# Altium project Servo-Board-v1.0.PrjPcb (part 8 of 23)

## Sheet DIO_3.SchDoc
size 420 x 297 mm; SheetNumber: 21; SheetTotal: 26
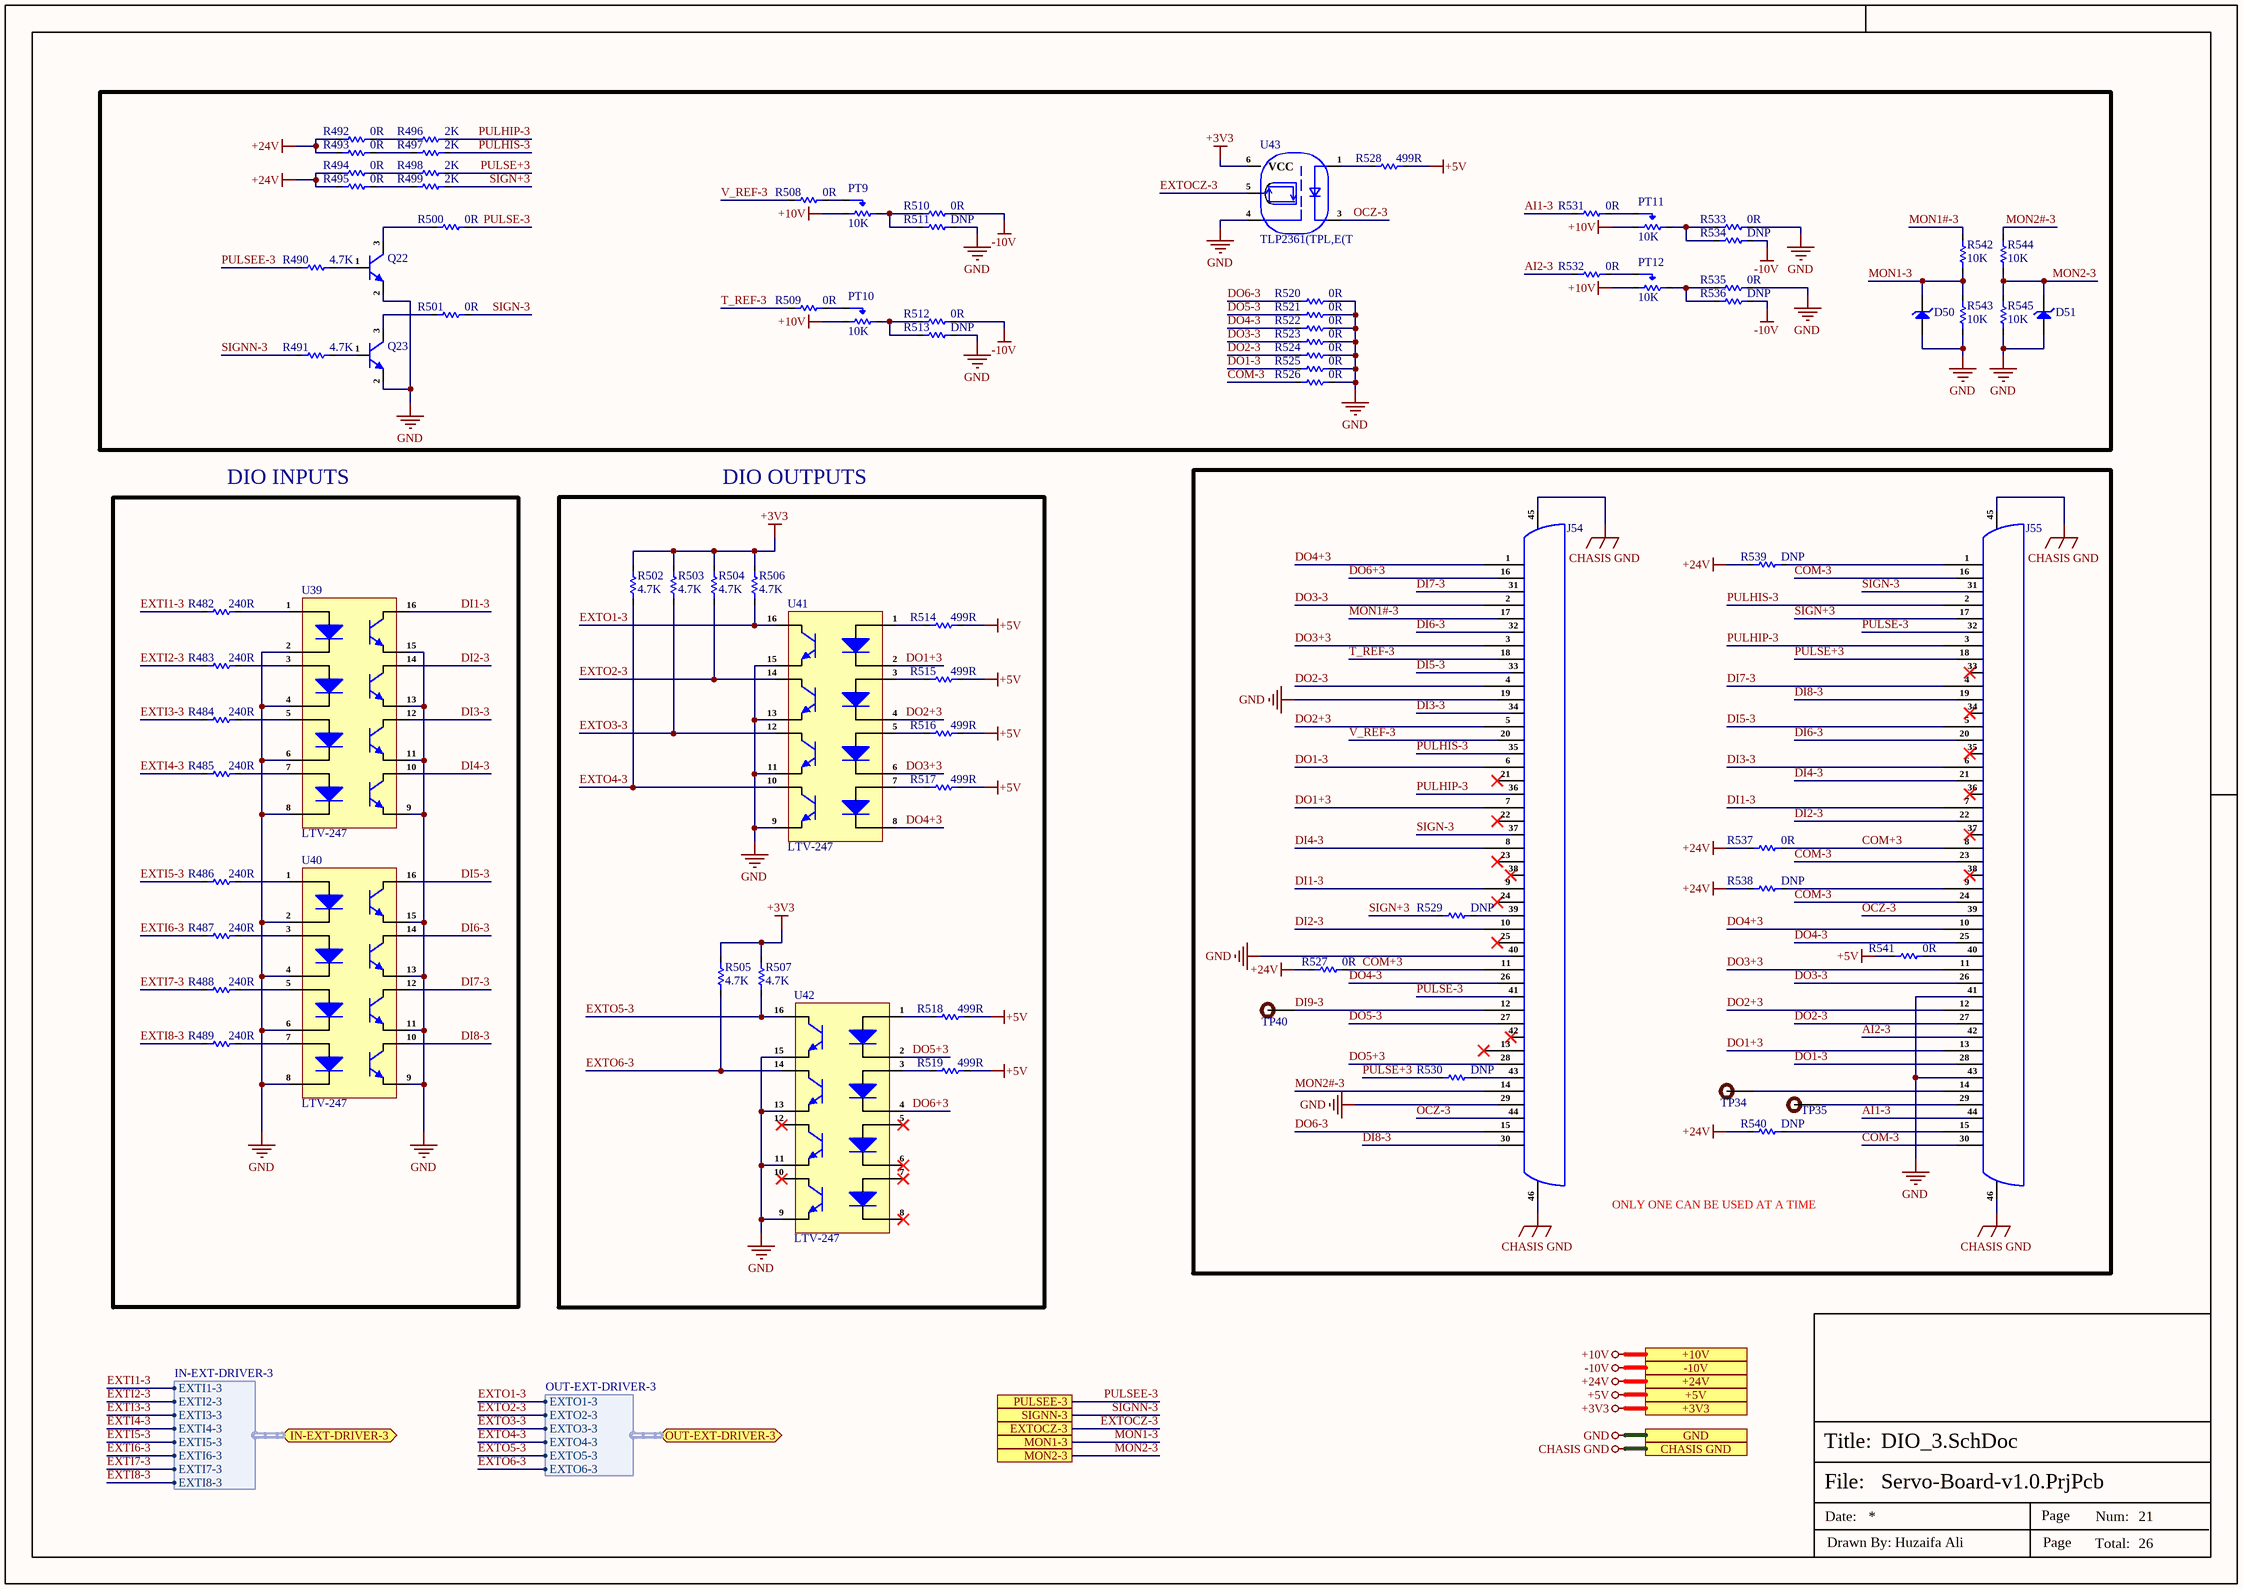
[diagram p9: DIO_3.SchDoc]

### Parts
D50  MM3Z3V3B  [SOD323F]  (value not drawn)
D51  MM3Z3V3B  [SOD323F]  (value not drawn)
J54  DS1038-44FBNSIA74-0CC  [DS1038-44FBNSIA74-0CC]  (value not drawn)
J55  DS1038-44FBNSIA74-0CC  [DS1038-44FBNSIA74-0CC]  (value not drawn)
PT9  10K  [3313J-1-103E]
PT10  10K  [3313J-1-103E]
PT11  10K  [3313J-1-103E]
PT12  10K  [3313J-1-103E]
Q22  NSS40201LT1G  [SOT-23]  (value not drawn)
Q23  NSS40201LT1G  [SOT-23]  (value not drawn)
R482  240R  [Res-0402]
R483  240R  [Res-0402]
R484  240R  [Res-0402]
R485  240R  [Res-0402]
R486  240R  [Res-0402]
R487  240R  [Res-0402]
R488  240R  [Res-0402]
R489  240R  [Res-0402]
R490  4.7K  [Res-0402]
R491  4.7K  [Res-0402]
R492  0R  [Res-0402]
R493  0R  [Res-0402]
R494  0R  [Res-0402]
R495  0R  [Res-0402]
R496  2K  [Res-0402]
R497  2K  [Res-0402]
R498  2K  [Res-0402]
R499  2K  [Res-0402]
R500  0R  [Res-0402]
R501  0R  [Res-0402]
R502  4.7K  [Res-0402]
R503  4.7K  [Res-0402]
R504  4.7K  [Res-0402]
R505  4.7K  [Res-0402]
R506  4.7K  [Res-0402]
R507  4.7K  [Res-0402]
R508  0R  [Res-0402]
R509  0R  [Res-0402]
R510  0R  [Res-0402]
R511  DNP  [Res-0402]
R512  0R  [Res-0402]
R513  DNP  [Res-0402]
R514  499R  [Res-0402]
R515  499R  [Res-0402]
R516  499R  [Res-0402]
R517  499R  [Res-0402]
R518  499R  [Res-0402]
R519  499R  [Res-0402]
R520  0R  [Res-0402]
R521  0R  [Res-0402]
R522  0R  [Res-0402]
R523  0R  [Res-0402]
R524  0R  [Res-0402]
R525  0R  [Res-0402]
R526  0R  [Res-0402]
R527  0R  [Res-0603]
R528  499R  [Res-0402]
R529  DNP  [Res-0402]
R530  DNP  [Res-0402]
R531  0R  [Res-0402]
R532  0R  [Res-0402]
R533  0R  [Res-0402]
R534  DNP  [Res-0402]
R535  0R  [Res-0402]
R536  DNP  [Res-0402]
R537  0R  [Res-0402]
R538  DNP  [Res-0402]
R539  DNP  [Res-0402]
R540  DNP  [Res-0402]
R541  0R  [Res-0402]
R542  10K  [Res-0402]
R543  10K  [Res-0402]
R544  10K  [Res-0402]
R545  10K  [Res-0402]
TP34  TEST POINT 0.5mm Dia  [Test-point - 0.5mm]  (value not drawn)  (no BOM)
TP35  TEST POINT 0.5mm Dia  [Test-point - 0.5mm]  (value not drawn)  (no BOM)
TP40  TEST POINT 0.5mm Dia  [Test-point - 0.5mm]  (value not drawn)  (no BOM)
U39  LTV-247  [16-SO]
U40  LTV-247  [16-SO]
U41  LTV-247  [16-SO]
U42  LTV-247  [16-SO]
U43  TLP2361(TPL,E(T  [SO-5]

### Blocks framed on the sheet
ONLY ONE CAN BE USED AT A TIME: J54 J55 R527 R529 R530 R537-R541 TP34 TP35 TP40

### Ports
+3V3 (see Servo3[4B], CAN_Sheet[4D], Controller_Sheet[5D], DIO_1[5D], DIO_2[5D], DIO_4[5D], Encoder_Sheet1[5D], Encoder_Sheet2[4D], Encoder_Sheet3[4D], Encoder_Sheet4[5D], EtherCAT_Sheet[5D], Motor_Driver_Sheet1[5D], Motor_Driver_Sheet2[5D], Motor_Driver_Sheet3[5D], Motor_Driver_Sheet4[5D], Power_Sheet[5D], RS485_RS232_Sheet[5D], Sec_Controller_Sheet1[5D], Sec_Controller_Sheet2[5D], Sec_Controller_Sheet3[5D], Sec_Controller_Sheet4[5D], Servo1[5D], Servo2[5D], Servo3[5D], Servo4[5D]), +5V (see Servo3[4A], CAN_Sheet[4D], Controller_Sheet[5D], DIO_1[5D], DIO_2[5D], DIO_4[5D], Encoder_Sheet1[5D], Encoder_Sheet2[4D], Encoder_Sheet3[4D], Encoder_Sheet4[5D], Power_Sheet[5D], Servo1[5D], Servo2[5D], Servo3[5D], Servo4[5D]), +10V (see Servo3[5A], DIO_1[5D], DIO_2[5D], DIO_4[5D], Power_Sheet[5D], Servo1[5D], Servo2[5D], Servo3[5D], Servo4[5D]), +24V (see Servo3[4A], DIO_1[5D], DIO_2[5D], DIO_4[5D], Power_Sheet[5D], Servo1[5D], Servo2[5D], Servo3[5D], Servo4[5D]), -10V (see Servo3[5A], DIO_1[5D], DIO_2[5D], DIO_4[5D], Power_Sheet[5D], Servo1[5D], Servo2[5D], Servo3[5D], Servo4[5D]), CHASIS GND (see Servo3[4B], DIO_1[5D], DIO_2[5D], DIO_4[5D], Encoder_Sheet1[5D], Encoder_Sheet2[4D], Encoder_Sheet3[4D], Encoder_Sheet4[5D], EtherCAT_Sheet[5D], Power_Sheet[5D], Servo1[5D], Servo2[5D], Servo3[5D], Servo4[5D]), EXTOCZ-3 (see Servo3[4B], Sec_Controller_Sheet3[5D]), GND (see Servo3[4B], CAN_Sheet[4D], Controller_Sheet[5D], DIO_1[5D], DIO_2[5D], DIO_4[5D], Encoder_Sheet1[5D], Encoder_Sheet2[4D], Encoder_Sheet3[4D], Encoder_Sheet4[5D], EtherCAT_Sheet[5D], Motor_Driver_Sheet1[5D], Motor_Driver_Sheet2[5D], Motor_Driver_Sheet3[5D], Motor_Driver_Sheet4[5D], Power_Sheet[5D], RS485_RS232_Sheet[5D], Sec_Controller_Sheet1[5D], Sec_Controller_Sheet2[5D], Sec_Controller_Sheet3[5D], Sec_Controller_Sheet4[5D], Servo1[5D], Servo2[5D], Servo3[5D], Servo4[5D]), IN-EXT-DRIVER-3 (bidir, harness IN-EXT-DRIVER-3, see Servo3[4B], Sec_Controller_Sheet3[3D]), MON1-3 (see Servo3[4B], Sec_Controller_Sheet3[5D]), MON2-3 (see Servo3[4B], Sec_Controller_Sheet3[5D]), OUT-EXT-DRIVER-3 (bidir, harness OUT-EXT-DRIVER-3, see Servo3[4B], Sec_Controller_Sheet3[3D]), PULSEE-3 (see Servo3[4B], Sec_Controller_Sheet3[5D]), SIGNN-3 (see Servo3[4B], Sec_Controller_Sheet3[5D])

### Harnesses
IN-EXT-DRIVER-3: EXTI1-3, EXTI2-3, EXTI3-3, EXTI4-3, EXTI5-3, EXTI6-3, EXTI7-3, EXTI8-3
OUT-EXT-DRIVER-3: EXTO1-3, EXTO2-3, EXTO3-3, EXTO4-3, EXTO5-3, EXTO6-3

### Nets
+3V3: R502.2 R503.2 R504.2 R505.2 R506.2 R507.2 U43.6(VCC) ; port +3V3
+5V: R514.2 R515.2 R516.2 R517.2 R518.2 R519.2 R528.2 R541.1 ; port +5V
+10V: PT9.1(CCW) PT10.1(CCW) PT11.1(CCW) PT12.1(CCW) ; port +10V
+24V: R492.1 R493.1 R494.1 R495.1 R527.1 R537.1 R538.1 R539.1 R540.1 ; port +24V
-10V: R510.2 R512.2 R534.2 R536.2 ; port -10V
CHASIS GND: J54.45 J54.46 J55.45 J55.46 ; port CHASIS GND
GND: D50.1(A) D51.1(A) J54.19 J54.29 J54.40 J55.41 J55.43 Q22.2(E) Q23.2(E) R511.2 R513.2 R520.2 R521.2 R522.2 R523.2 R524.2 R525.2 R526.2 R533.2 R535.2 R543.1 R545.1 U39.2(K) U39.4(K) U39.6(K) U39.8(K) U39.9(E) U39.11(E) U39.13(E) U39.15(E) U40.2(K) U40.4(K) U40.6(K) U40.8(K) U40.9(E) U40.11(E) U40.13(E) U40.15(E) U41.9(E) U41.11(E) U41.13(E) U41.15(E) U42.9(E) U42.11(E) U42.13(E) U42.15(E) U43.4(GND) ; port GND
AI1-3: J55.44 R531.1
AI2-3: J55.42 R532.1
COM+3: J54.11 J55.8 R527.2 R537.2
COM-3: J55.16 J55.23 J55.24 J55.30 R526.1
DI1-3: J54.9 J55.7 U39.16(C)
DI2-3: J54.10 J55.22 U39.14(C)
DI3-3: J54.34 J55.6 U39.12(C)
DI4-3: J54.8 J55.21 U39.10(C)
DI5-3: J54.33 J55.5 U40.16(C)
DI6-3: J54.32 J55.20 U40.14(C)
DI7-3: J54.31 J55.4 U40.12(C)
DI8-3: J54.30 J55.19 U40.10(C)
DI9-3: J54.12 TP40.1
DO1+3: J54.7 J55.13 U41.2(K)
DO1-3: J54.6 J55.28 R525.1
DO2+3: J54.5 J55.12 U41.4(K)
DO2-3: J54.4 J55.27 R524.1
DO3+3: J54.3 J55.11 U41.6(K)
DO3-3: J54.2 J55.26 R523.1
DO4+3: J54.1 J55.10 U41.8(K)
DO4-3: J54.26 J55.25 R522.1
DO5+3: J54.28 U42.2(K)
DO5-3: J54.27 R521.1
DO6+3: J54.16 U42.4(K)
DO6-3: J54.15 R520.1
EXTI1-3: R482.1 ; port IN-EXT-DRIVER-3.EXTI1-3
EXTI2-3: R483.1 ; port IN-EXT-DRIVER-3.EXTI2-3
EXTI3-3: R484.1 ; port IN-EXT-DRIVER-3.EXTI3-3
EXTI4-3: R485.1 ; port IN-EXT-DRIVER-3.EXTI4-3
EXTI5-3: R486.1 ; port IN-EXT-DRIVER-3.EXTI5-3
EXTI6-3: R487.1 ; port IN-EXT-DRIVER-3.EXTI6-3
EXTI7-3: R488.1 ; port IN-EXT-DRIVER-3.EXTI7-3
EXTI8-3: R489.1 ; port IN-EXT-DRIVER-3.EXTI8-3
EXTO1-3: R506.1 U41.16(C) ; port OUT-EXT-DRIVER-3.EXTO1-3
EXTO2-3: R504.1 U41.14(C) ; port OUT-EXT-DRIVER-3.EXTO2-3
EXTO3-3: R503.1 U41.12(C) ; port OUT-EXT-DRIVER-3.EXTO3-3
EXTO4-3: R502.1 U41.10(C) ; port OUT-EXT-DRIVER-3.EXTO4-3
EXTO5-3: R507.1 U42.16(C) ; port OUT-EXT-DRIVER-3.EXTO5-3
EXTO6-3: R505.1 U42.14(C) ; port OUT-EXT-DRIVER-3.EXTO6-3
EXTOCZ-3: U43.5(VO) ; port EXTOCZ-3
MON1#-3: J54.17 R542.2
MON1-3: D50.2(K) R542.1 R543.2 ; port MON1-3
MON2#-3: J54.14 R544.2
MON2-3: D51.2(K) R544.1 R545.2 ; port MON2-3
OCZ-3: J54.44 J55.39 U43.3(CAT)
PULHIP-3: J54.36 J55.3 R496.2
PULHIS-3: J54.35 J55.2 R497.2
PULSE+3: J55.18 R498.2 R530.1
PULSE-3: J54.41 J55.32 R500.2
PULSEE-3: R490.1 ; port PULSEE-3
SIGN+3: J55.17 R499.2 R529.1
SIGN-3: J54.37 J55.31 R501.2
SIGNN-3: R491.1 ; port SIGNN-3
T_REF-3: J54.18 R509.1
V_REF-3: J54.20 R508.1
NetJ54_39: J54.39 R529.2
NetJ54_43: J54.43 R530.2
NetJ55_1: J55.1 R539.2
NetJ55_9: J55.9 R538.2
NetJ55_14: J55.14 TP34.1
NetJ55_15: J55.15 R540.2
NetJ55_29: J55.29 TP35.1
NetJ55_40: J55.40 R541.2
NetPT9_2: PT9.2(Wiper) R508.2
NetPT9_3: PT9.3(CW) R510.1 R511.1
NetPT10_2: PT10.2(Wiper) R509.2
NetPT10_3: PT10.3(CW) R512.1 R513.1
NetPT11_2: PT11.2(Wiper) R531.2
NetPT11_3: PT11.3(CW) R533.1 R534.1
NetPT12_2: PT12.2(Wiper) R532.2
NetPT12_3: PT12.3(CW) R535.1 R536.1
NetQ22_1: Q22.1(B) R490.2
NetQ22_3: Q22.3(C) R500.1
NetQ23_1: Q23.1(B) R491.2
NetQ23_3: Q23.3(C) R501.1
NetR482_2: R482.2 U39.1(A)
NetR483_2: R483.2 U39.3(A)
NetR484_2: R484.2 U39.5(A)
NetR485_2: R485.2 U39.7(A)
NetR486_2: R486.2 U40.1(A)
NetR487_2: R487.2 U40.3(A)
NetR488_2: R488.2 U40.5(A)
NetR489_2: R489.2 U40.7(A)
NetR492_2: R492.2 R496.1
NetR493_2: R493.2 R497.1
NetR494_2: R494.2 R498.1
NetR495_2: R495.2 R499.1
NetR514_1: R514.1 U41.1(A)
NetR515_1: R515.1 U41.3(A)
NetR516_1: R516.1 U41.5(A)
NetR517_1: R517.1 U41.7(A)
NetR518_1: R518.1 U42.1(A)
NetR519_1: R519.1 U42.3(A)
NetR528_1: R528.1 U43.1(AN)

Not connected (* = marked no-connect by the designer): J54 13* 21* 22* 23* 24* 25* 38* 42*; J55 33* 34* 35* 36* 37* 38*; U42 5(A)* 6(K)* 7(A)* 8(K)* 10(C)* 12(C)*

### Notes on the sheet
- DIO INPUTS
- DIO OUTPUTS
- File:
- Title:
- Date:
- Page
- Num:
- Total:
- Drawn By: Huzaifa Ali

### Library data of the parts
D50 D51 = MM3Z3V3B: as D60 on sheet Motor_Driver_Sheet3; Supplier 1: Digi-Key; Manufacturer Part Number: MM3Z3V3B; Stock 1: 473644; Pricing 1: 1=0.22, 10=0.18, 100=0.0956, 500=0.06288, 1000=0.04276 (USD); Mount: Surface Mount; Number of Pins: 2; Weight: 0.0276g; Min Operating Temperature: -65°C; Max Operating Temperature: 150°C; Packaging: Tape and Reel; Package Quantity: 1; Max Power Dissipation: 200mW; Zener Voltage: 3.3V; Voltage Tolerance: 2%; Power Dissipation: 200mW; Working Voltage: 3.3V; Peak Reverse Current: 4.5uA; Length: 1.3mm; Height: 1mm; Width: 1.7mm; Radiation Hardening: No; REACH SVHC: No SVHC; Lead Free: Lead Free; ComponentLink1URL: http://www.onsemi.com/pub/Collateral/MM3Z9V1B-D.pdf?src-supplier=Digi-Key; ComponentLink1Description: http://www.onsemi.com/pub/Collateral/MM3Z9V1B-D.pdf?src-supplier=Digi-Key; ComponentLink2URL: http://www.mouser.com/ds/2/149/MM3Z3V3B-187166.pdf?src-supplier=Mouser; ComponentLink2Description: http://www.mouser.com/ds/2/149/MM3Z3V3B-187166.pdf?src-supplier=Mouser; ComponentLink3URL: https://www.fairchildsemi.com/datasheets/MM/MM3Z9V1B.pdf?src-supplier=Avnet; ComponentLink3Description: https://www.fairchildsemi.com/datasheets/MM/MM3Z9V1B.pdf?src-supplier=Avnet; ComponentLink4URL: http://www.farnell.com/datasheets/1706525.pdf?src-supplier=Element14; ComponentLink4Description: http://www.farnell.com/datasheets/1706525.pdf?src-supplier=Element14; Supplier Part Number 1: MM3Z3V3BCT-ND; LCSC Part Number: C2978865; Item Type: Diode
J54 J55 = DS1038-44FBNSIA74-0CC: 44P Female D-Sub Right-Angle 3 1.5A -40℃~+105℃ Push-Pull D-Sub / VGA connector ROHS; Manufacturer: CONNFLY Elec; Manufacturer Part Number: DS1038-44FBNSIA74-0CC; Package: Push-Pull; LCSC Part Number: C77844; Item Type: D-Sub / VGA connector; ComponentLink1Description: LCSC; ComponentLink1URL: https://www.lcsc.com/product-detail/D-Sub-VGA-connector_CONNFLY-Elec-DS1038-44FBNSIA74-0CC_C77844.html
PT9-PT12 = 3313J-1-103E: TRIMMER 10KOHM 0.125W J LEAD TOP; Manufacturer: Bourns; Value: 10kR; Tolerance: 20%; Power Rating: 125mW; Number of Turns: 1; Temperature Coefficient: 100ppm/°C; Insulation Resistance: 100MR; Voltage Rating (DC): 500V; Item Type: Potentiometer; Supplier 1: Digi-Key; Manufacturer Part Number: 3313J-1-103E; RoHS: Yes; Category: Variable Resistors and Potentiometers; Stock 1: 15653; Pricing 1: 1=1.83, 10=1.611, 25=1.4444, 50=1.3888, 100=1.3332, 250=1.27764, 500=1.05544 (USD); Mounting Technology: Surface Mount; Weight: 283mg; Color: Natural; Min Operating Temperature: -55°C; Max Operating Temperature: 125°C; Resistor Type: Cermet; Package Quantity: 1000; Packaging: Tape and Reel; Termination: J-Hook; Taper: Linear; Max Power Dissipation: 125mW; Type: Potentiometer; Series: Trimpot® 3313 - Sealed; Resistance Tolerance: 20%; Technology: CERMET; Length: 3.2mm; Width: 3.2mm; Height: 2.2mm; Depth: 3.5mm; Radiation Hardening: No; Reach SVHC Compliant: No; Military Standard: Not; Lead Free: Lead Free; RoHS Compliant: Yes; ComponentLink1URL: https://datasheet.ciiva.com/6197/1719390-6197392.pdf?src-supplier=Farnell; ComponentLink1Description: https://datasheet.ciiva.com/6197/1719390-6197392.pdf?src-supplier=Farnell; ComponentLink2URL: https://datasheet.ciiva.com/11831/0900766b80dbb89c-11831555.pdf?src-supplier=Rs; ComponentLink2Description: https://datasheet.ciiva.com/11831/0900766b80dbb89c-11831555.pdf?src-supplier=Rs; ComponentLink3URL: https://datasheet.ciiva.com/43573/1157501-43573718.pdf?src-supplier=Jameco; ComponentLink3Description: https://datasheet.ciiva.com/43573/1157501-43573718.pdf?src-supplier=Jameco; ComponentLink4URL: https://datasheet.ciiva.com/7953/1864507-7953225.pdf?src-supplier=Element14; ComponentLink4Description: https://datasheet.ciiva.com/7953/1864507-7953225.pdf?src-supplier=Element14; ComponentLink5URL: https://datasheet.ciiva.com/28659/1770668-28659191.pdf?src-supplier=Element14; ComponentLink5Description: https://datasheet.ciiva.com/28659/1770668-28659191.pdf?src-supplier=Element14; ComponentLink6URL: https://datasheet.ciiva.com/2156/3313-2156355.pdf?src-supplier=Digi-Key; ComponentLink6Description: https://datasheet.ciiva.com/2156/3313-2156355.pdf?src-supplier=Digi-Key; ComponentLink7URL: https://datasheet.ciiva.com/2156/3313-2156356.pdf?src-supplier=Digi-Key; ComponentLink7Description: https://datasheet.ciiva.com/2156/3313-2156356.pdf?src-supplier=Digi-Key; ComponentLink8URL: https://datasheet.ciiva.com/2156/3313-2156354.pdf?src-supplier=Digi-Key; ComponentLink8Description: https://datasheet.ciiva.com/2156/3313-2156354.pdf?src-supplier=Digi-Key; ComponentLink9URL: https://datasheet.ciiva.com/16715/70153423-16715693.pdf?src-supplier=Allied+Electronics; ComponentLink9Description: https://datasheet.ciiva.com/16715/70153423-16715693.pdf?src-supplier=Allied+Electronics; Supplier Part Number 1: 3313J-103ECT-ND; LCSC Part Number: C124616
Q22 Q23 = NSS40201LT1G: TRANS NPN 40V 2A SOT23-3; Manufacturer: ON Semiconductor; Max Power Dissipation: 540mW; Transition Frequency: 150MHz; hFE Min: 200; Number of Elements: 1; Emitter Base Voltage (VEBO): 6V; Collector Emitter Saturation Voltage: 115mV; Element Configuration: Single; Clock Frequency: 100MHz; Item Type: Transistor; Supplier 1: Future Electronics; Manufacturer Part Number: NSS40201LT1G; RoHS: Yes; Category: BJTs; Stock 1: 155; Pricing 1: 1=0.42000, 15=0.34000, 75=0.29500, 300=0.25500, 1500=0.21000 (USD); Case/Package: SOT-23-3; Pins: 3; Min Operating Temperature: -55°C; Max Operating Temperature: 150°C; Collector Emitter Voltage (VCEO): 40V; Packaging: Tape and Reel; Max Collector Current: 2A; Collector Emitter Breakdown Voltage: 40V; Polarity: NPN; Package Quantity: 3000; Frequency: 150MHz; Max Breakdown Voltage: 40V; Collector Base Voltage (VCBO): 40V; Power Dissipation: 540mW; Gain Bandwidth Product: 150MHz; Series: -; Collector-emitter Voltage-Max: 115mV; Length: 3.04mm; Width: 2.64mm; Height: 1.11mm; Radiation Hardening: No; Lead Free: Lead Free; Reach SVHC Compliant: Yes; Halogen Free: Halogen Free; RoHS Compliant: Yes; ComponentLink1URL: https://datasheet.ciiva.com/976/nss40201l-d-976800.pdf?src-supplier=Digi-Key; ComponentLink1Description: https://datasheet.ciiva.com/976/nss40201l-d-976800.pdf?src-supplier=Digi-Key; ComponentLink2URL: https://datasheet.ciiva.com/11204/nss40201l-d-11204882.pdf?src-supplier=Avnet; ComponentLink2Description: https://datasheet.ciiva.com/11204/nss40201l-d-11204882.pdf?src-supplier=Avnet; ComponentLink3URL: https://datasheet.ciiva.com/16291/nss40201l-d-115376-16291797.pdf?src-supplier=Mouser; ComponentLink3Description: https://datasheet.ciiva.com/16291/nss40201l-d-115376-16291797.pdf?src-supplier=Mouser; ComponentLink4URL: https://datasheet.ciiva.com/30480/0900766b8121b5a5-30480502.pdf?src-supplier=Rs; ComponentLink4Description: https://datasheet.ciiva.com/30480/0900766b8121b5a5-30480502.pdf?src-supplier=Rs; ComponentLink5URL: https://datasheet.ciiva.com/976/nss40201l-d-976801.pdf?src-supplier=Digi-Key; ComponentLink5Description: https://datasheet.ciiva.com/976/nss40201l-d-976801.pdf?src-supplier=Digi-Key; ComponentLink6URL: https://datasheet.ciiva.com/976/nss40201l-d-976802.pdf?src-supplier=Digi-Key; ComponentLink6Description: https://datasheet.ciiva.com/976/nss40201l-d-976802.pdf?src-supplier=Digi-Key; ComponentLink7URL: https://datasheet.ciiva.com/22641/nss40201l-d-22641179.pdf?src-supplier=Farnell; ComponentLink7Description: https://datasheet.ciiva.com/22641/nss40201l-d-22641179.pdf?src-supplier=Farnell; ComponentLink8URL: https://datasheet.ciiva.com/16222/nss40201l-d-16222093.pdf?src-supplier=Future+Electronics; ComponentLink8Description: https://datasheet.ciiva.com/16222/nss40201l-d-16222093.pdf?src-supplier=Future+Electronics; Supplier Part Number 1: 6030674; LCSC Part Number: C145175
R482-R489 = RC0402FR-07240RL: as R214 on sheet Motor_Driver_Sheet3; Supplier 1: Mouser; Manufacturer Part Number: RC0402FR-07240RL; RoHS: Yes; Stock 1: 1903202; Pricing 1: 1=0.10000, 10=0.01200, 50=0.01200, 100=0.00500, 1000=0.00300, 10000=0.00100 (USD); Case/Package: 0402; Case Code (Metric): 1005; Case Code (Imperial): 0402; Size Code: 0402; Min Operating Temperature: -55°C; Max Operating Temperature: 155°C; Resistance: 240R; Tolerance: 1%; Packaging: Tape and Reel; Resistor Type: Thick Film; Voltage Rating: 50V; Package Quantity: 1; Number of Terminations: 2; Termination: SMD/SMT; Max Power Dissipation: 63mW; Features: Moisture Resistant; Series: RC; Construction: Rectangular; Resistance Tolerance: 1%; Length: 1mm; Width: 0.02inch; Height: 0.016inch; Depth: 0.5mm; REACH SVHC: Unknown; Lead Free: Lead Free; RoHS Compliant: Yes; Military Standard: Not; ComponentLink1URL: https://datasheet.ciiva.com/7849/1018594-7849915.pdf?src-supplier=Element14; ComponentLink1Description: https://datasheet.ciiva.com/7849/1018594-7849915.pdf?src-supplier=Element14; ComponentLink2URL: https://datasheet.ciiva.com/7849/1018594-7849916.pdf?src-supplier=Element14; ComponentLink2Description: https://datasheet.ciiva.com/7849/1018594-7849916.pdf?src-supplier=Element14; ComponentLink3URL: https://datasheet.ciiva.com/2519/pyu-r-int-thick-7-2519157.pdf?src-supplier=Digi-Key; ComponentLink3Description: https://datasheet.ciiva.com/2519/pyu-r-int-thick-7-2519157.pdf?src-supplier=Digi-Key; ComponentLink4URL: https://datasheet.ciiva.com/2519/pyu-r-int-thick-7-2519158.pdf?src-supplier=Digi-Key; ComponentLink4Description: https://datasheet.ciiva.com/2519/pyu-r-int-thick-7-2519158.pdf?src-supplier=Digi-Key; ComponentLink5URL: https://datasheet.ciiva.com/2519/pyu-r-int-thick-7-2519156.pdf?src-supplier=Digi-Key; ComponentLink5Description: https://datasheet.ciiva.com/2519/pyu-r-int-thick-7-2519156.pdf?src-supplier=Digi-Key; ComponentLink6URL: https://datasheet.ciiva.com/12669/pyu-rc0402-51-rohs-l-6-r-12669689.pdf?src-supplier=Mouser; ComponentLink6Description: https://datasheet.ciiva.com/12669/pyu-rc0402-51-rohs-l-6-r-12669689.pdf?src-supplier=Mouser; ComponentLink7URL: https://datasheet.ciiva.com/17419/pyu-rc0402-51-rohs-l-6-r-17419482.pdf?src-supplier=Future+Electronics; ComponentLink7Description: https://datasheet.ciiva.com/17419/pyu-rc0402-51-rohs-l-6-r-17419482.pdf?src-supplier=Future+Electronics; Supplier Part Number 1: 603-RC0402FR-07240RL; LCSC Part Number: C114755
R490 R491 R502-R507 = RC0402FR-074K7L: as R210 on sheet Motor_Driver_Sheet3; Supplier 1: Avnet; Manufacturer Part Number: RC0402FR-074K7L; RoHS: Yes; Category: Chip SMD Resistors; Stock 1: 2420000; Pricing 1: 10000=0.00085 (USD); Case/Package: 0402; Number of Pins: 2; Case Code (Imperial): 0402; Case Code (Metric): 1005; Size Code: 0402; Min Operating Temperature: -55°C; Max Operating Temperature: 155°C; Tolerance: 1%; Voltage Rating: 50V; Packaging: Tape and Reel; Resistor Type: Thick Film; Termination: SMD/SMT; Features: Moisture Resistant; Series: RC; Number of Terminations: 2; Resistance Tolerance: 1%; Construction: Rectangular; Length: 1mm; Width: 0.5mm; Height: 0.32mm; Depth: 0.5mm; Height - Seated (Max): 0.016inch; RoHS Compliant: Yes; Reach SVHC Compliant: Yes; Military Standard: Not; Lead Free: Lead Free; ComponentLink1URL: https://datasheet.ciiva.com/22661/1686128-22661342.pdf?src-supplier=Element14; ComponentLink1Description: https://datasheet.ciiva.com/22661/1686128-22661342.pdf?src-supplier=Element14; ComponentLink2URL: https://datasheet.ciiva.com/7850/1018594-7850022.pdf?src-supplier=Element14; ComponentLink2Description: https://datasheet.ciiva.com/7850/1018594-7850022.pdf?src-supplier=Element14; ComponentLink3URL: https://datasheet.ciiva.com/7850/1018594-7850023.pdf?src-supplier=Element14; ComponentLink3Description: https://datasheet.ciiva.com/7850/1018594-7850023.pdf?src-supplier=Element14; ComponentLink4URL: https://datasheet.ciiva.com/15215/getdatasheetpartid-328119-15215035.pdf?src-supplier=Verical; ComponentLink4Description: https://datasheet.ciiva.com/15215/getdatasheetpartid-328119-15215035.pdf?src-supplier=Verical; Supplier Part Number 1: RC0402FR-074K7L; LCSC Part Number: C105871
R492-R495 R500 R501 R508-R510 R512 R520-R526 R531-R533 R535 R537 R541 = RC0402FR-070RL: as R122 on sheet Sec_Controller_Sheet3; Supplier 1: Mouser; Manufacturer Part Number: RC0402FR-070RL; RoHS: Yes; Stock 1: 8556842; Pricing 1: 1=0.10000, 10=0.01400, 50=0.01400, 100=0.00600, 1000=0.00300, 5000=0.00200, 10000=0.00100 (USD); Mount: Surface Mount; Case/Package: 0402; Contact Plating: Tin,Matte; Case Code (Imperial): 0402; Case Code (Metric): 1005; Size Code: 0402; Min Operating Temperature: -55°C; Max Operating Temperature: 155°C; Resistance: 0R; Resistor Type: Thick Film; Packaging: Tape and Reel; Termination: SMD/SMT; Features: Moisture Resistant; Series: RC; Number of Terminations: 2; Length: 1mm; Width: 0.5mm; Height: 0.35mm; Radiation Hardening: No; Lead Free: Lead Free; RoHS Compliant: Yes; ComponentLink1URL: https://datasheet.ciiva.com/8896/pyu-rc0402-51-rohs-l-6-8896149.pdf?src-supplier=Avnet; ComponentLink1Description: https://datasheet.ciiva.com/8896/pyu-rc0402-51-rohs-l-6-8896149.pdf?src-supplier=Avnet; ComponentLink2URL: https://datasheet.ciiva.com/16790/pyu-rc0402-51-rohs-l-6-r-16790444.pdf?src-supplier=Future+Electronics; ComponentLink2Description: https://datasheet.ciiva.com/16790/pyu-rc0402-51-rohs-l-6-r-16790444.pdf?src-supplier=Future+Electronics; Supplier Part Number 1: 603-RC0402FR-070RL; LCSC Part Number: C106231
R496-R499 = RC0402FR-072KL: RES 2K OHM 1% 1/16W 0402; Manufacturer: Yageo; Item Type: Resistor; Value: 2kR; Power Rating: 63mW; Voltage Rating: 50V; Temperature Coefficient: 100ppm/°C; LCSC Part Number: C60488; ComponentLink2URL: https://datasheet.ciiva.com/11808/0900766b80c66297-11808787.pdf?src-supplier=Rs; ComponentLink2Description: https://datasheet.ciiva.com/11808/0900766b80c66297-11808787.pdf?src-supplier=Rs; ComponentLink3URL: https://datasheet.ciiva.com/7849/1018594-7849934.pdf?src-supplier=Element14; ComponentLink3Description: https://datasheet.ciiva.com/7849/1018594-7849934.pdf?src-supplier=Element14; ComponentLink4URL: https://datasheet.ciiva.com/7849/1018594-7849935.pdf?src-supplier=Element14; ComponentLink4Description: https://datasheet.ciiva.com/7849/1018594-7849935.pdf?src-supplier=Element14; ComponentLink5URL: https://datasheet.ciiva.com/7983/1018594-7983517.pdf?src-supplier=Element14; ComponentLink5Description: https://datasheet.ciiva.com/7983/1018594-7983517.pdf?src-supplier=Element14; ComponentLink6URL: https://datasheet.ciiva.com/2453/pyu-r-int-thick-7-2453635.pdf?src-supplier=Digi-Key; ComponentLink6Description: https://datasheet.ciiva.com/2453/pyu-r-int-thick-7-2453635.pdf?src-supplier=Digi-Key; ComponentLink7URL: https://datasheet.ciiva.com/2453/pyu-r-int-thick-7-2453636.pdf?src-supplier=Digi-Key; ComponentLink7Description: https://datasheet.ciiva.com/2453/pyu-r-int-thick-7-2453636.pdf?src-supplier=Digi-Key; ComponentLink8URL: https://datasheet.ciiva.com/2453/pyu-r-int-thick-7-2453634.pdf?src-supplier=Digi-Key; ComponentLink8Description: https://datasheet.ciiva.com/2453/pyu-r-int-thick-7-2453634.pdf?src-supplier=Digi-Key; ComponentLink9URL: https://datasheet.ciiva.com/12667/pyu-rc0402-51-rohs-l-6-r-12667451.pdf?src-supplier=Mouser; ComponentLink9Description: https://datasheet.ciiva.com/12667/pyu-rc0402-51-rohs-l-6-r-12667451.pdf?src-supplier=Mouser; ComponentLink10URL: https://datasheet.ciiva.com/15189/getdatasheetpartid-358921-15189414.pdf?src-supplier=Verical; ComponentLink10Description: https://datasheet.ciiva.com/15189/getdatasheetpartid-358921-15189414.pdf?src-supplier=Verical; Supplier: Future Electronics; Supplier Part Number: 7970452; Manufacturer Part Number: RC0402FR-072KL; RoHS: Yes; Category: Chip SMD Resistors; Stock: 8530000; Pricing: 10000=0.0018, 100000=0.0011, 200000=0.0017, 300000=0.001, 750000=0.0016, 2000000=0.0009, 2500000=0.0016, 10000000=0.0014 (USD); Case/Package: 0402; Case Code (Metric): 1005; Case Code (Imperial): 0402; Min Operating Temperature: -55°C; Max Operating Temperature: 155°C; Resistor Type: Thick Film; Tolerance: 1%; Package Quantity: 1; Packaging: Tape and Reel; Number of Terminations: 2; Termination: SMD/SMT; Max Power Dissipation: 63mW; Working Voltage: 50V; Features: Moisture Resistant; Series: RC; Technology: THICK FILM; Construction: Rectangular; Resistance Tolerance: 1%; Voltage Rating (DC): 50V; Length: 0.039inch; Width: 0.02inch; Height: 0.016inch; Depth: 0.5mm; RoHS Compliant: Yes; Military Standard: Not; Reach SVHC Compliant: Unknown; Lead Free: 5697LeadFree; ComponentLink1URL: https://datasheet.ciiva.com/11808/0900766b80c66297-11808787.pdf?src-supplier=Rs; ComponentLink1Description: https://datasheet.ciiva.com/11808/0900766b80c66297-11808787.pdf?src-supplier=Rs; ComponentLink11URL: https://datasheet.ciiva.com/2453/pyu-r-int-thick-7-2453635.pdf?src-supplier=Digikey; ComponentLink11Description: https://datasheet.ciiva.com/2453/pyu-r-int-thick-7-2453635.pdf?src-supplier=Digikey; ComponentLink12URL: https://datasheet.ciiva.com/2453/pyu-r-int-thick-7-2453636.pdf?src-supplier=Digikey; ComponentLink12Description: https://datasheet.ciiva.com/2453/pyu-r-int-thick-7-2453636.pdf?src-supplier=Digikey; ComponentLink13URL: https://datasheet.ciiva.com/2453/pyu-r-int-thick-7-2453634.pdf?src-supplier=Digikey; ComponentLink13Description: https://datasheet.ciiva.com/2453/pyu-r-int-thick-7-2453634.pdf?src-supplier=Digikey
R511 R513 R529 R530 R534 R536 R538-R540 = RC0402FR-070RL: as R127 on sheet Sec_Controller_Sheet3; Supplier 1: Mouser; Manufacturer Part Number: RC0402FR-070RL; RoHS: Yes; Stock 1: 8556842; Pricing 1: 1=0.10000, 10=0.01400, 50=0.01400, 100=0.00600, 1000=0.00300, 5000=0.00200, 10000=0.00100 (USD); Mount: Surface Mount; Case/Package: 0402; Contact Plating: Tin,Matte; Case Code (Imperial): 0402; Case Code (Metric): 1005; Size Code: 0402; Min Operating Temperature: -55°C; Max Operating Temperature: 155°C; Resistor Type: Thick Film; Packaging: Tape and Reel; Termination: SMD/SMT; Features: Moisture Resistant; Series: RC; Number of Terminations: 2; Length: 1mm; Width: 0.5mm; Height: 0.35mm; Radiation Hardening: No; Lead Free: Lead Free; RoHS Compliant: Yes; ComponentLink1URL: https://datasheet.ciiva.com/8896/pyu-rc0402-51-rohs-l-6-8896149.pdf?src-supplier=Avnet; ComponentLink1Description: https://datasheet.ciiva.com/8896/pyu-rc0402-51-rohs-l-6-8896149.pdf?src-supplier=Avnet; ComponentLink2URL: https://datasheet.ciiva.com/16790/pyu-rc0402-51-rohs-l-6-r-16790444.pdf?src-supplier=Future+Electronics; ComponentLink2Description: https://datasheet.ciiva.com/16790/pyu-rc0402-51-rohs-l-6-r-16790444.pdf?src-supplier=Future+Electronics; Supplier Part Number 1: 603-RC0402FR-070RL; LCSC Part Number: C106231
R514-R519 R528 = RC0402FR-07499RL: RES 499 OHM 1% 1/16W 0402; Manufacturer: Yageo; Power Rating: 62.5mW; Voltage Rating: 50V; Max Power Dissipation: 63mW; Temperature Coefficient: 100ppm/°C; Supplier 1: Mouser; Manufacturer Part Number: RC0402FR-07499RL; RoHS: Yes; Category: Chip SMD Resistors; Stock 1: 936879; Pricing 1: 1=0.10000, 10=0.01200, 50=0.01200, 100=0.00500, 1000=0.00300, 10000=0.00100 (USD); Case/Package: 0402; Case Code (Metric): 1005; Case Code (Imperial): 0402; Size Code: 0402; Min Operating Temperature: -55°C; Max Operating Temperature: 155°C; Resistance: 499R; Tolerance: 1%; Package Quantity: 1; Packaging: Tape and Reel; Resistor Type: Thick Film; Number of Terminations: 2; Termination: SMD/SMT; Voltage Rating (DC): 50V; Features: Moisture Resistant; Series: RC; Resistance Tolerance: 1%; Construction: Rectangular; Length: 1mm; Width: 0.02inch; Height: 0.016inch; Depth: 0.5mm; RoHS Compliant: Yes; REACH SVHC: No SVHC; Military Standard: Not; Lead Free: Lead Free; ComponentLink1URL: https://datasheet.ciiva.com/2453/pyu-r-int-thick-7-2453539.pdf?src-supplier=Digi-Key; ComponentLink1Description: https://datasheet.ciiva.com/2453/pyu-r-int-thick-7-2453539.pdf?src-supplier=Digi-Key; ComponentLink2URL: https://datasheet.ciiva.com/2453/pyu-r-int-thick-7-2453540.pdf?src-supplier=Digi-Key; ComponentLink2Description: https://datasheet.ciiva.com/2453/pyu-r-int-thick-7-2453540.pdf?src-supplier=Digi-Key; ComponentLink3URL: https://datasheet.ciiva.com/2453/pyu-r-int-thick-7-2453538.pdf?src-supplier=Digi-Key; ComponentLink3Description: https://datasheet.ciiva.com/2453/pyu-r-int-thick-7-2453538.pdf?src-supplier=Digi-Key; Supplier Part Number 1: 603-RC0402FR-07499RL; LCSC Part Number: C137970
R527 = RC0603JR-070RL: as R114 on sheet Sec_Controller_Sheet3; Supplier 1: Digi-Key; Manufacturer Part Number: RC0603JR-070RL; RoHS: Yes; Category: Chip SMD Resistors; Stock 1: 18081776; Pricing 1: 1=0.10000, 10=0.01700, 25=0.01240, 50=0.00960, 100=0.00700, 250=0.00536, 500=0.00430, 1000=0.00316 (USD); Case/Package: 0603; Number of Pins: 2; Contact Plating: Tin,Matte; Case Code (Imperial): 0603; Case Code (Metric): 1608; Size Code: 0603; Min Operating Temperature: -55°C; Max Operating Temperature: 155°C; Resistor Type: Thick Film; Packaging: Tape and Reel; Termination: SMD/SMT; Series: RC; Technology: THICK FILM; Package Quantity: 5000; Voltage Rating: 50V; Features: Moisture Resistant; Max Power Dissipation: 100mW; Number of Terminations: 2; Construction: Rectangular; Length: 1.6mm; Width: 0.8mm; Height: 0.45mm; Depth: 0.8mm; Radiation Hardening: No; Reach SVHC Compliant: No SVHC; Lead Free: Lead Free; RoHS Compliant: Yes; Military Standard: Not; Supplier Part Number 1: 311-0.0GRCT-ND; LCSC Part Number: C95177
R542-R545 = RC0402FR-0710KL: as R116 on sheet Sec_Controller_Sheet3; Supplier 1: Mouser; Manufacturer Part Number: RC0402FR-0710KL; RoHS: Yes; Category: Chip SMD Resistors; Stock 1: 18648329; Pricing 1: 1=0.10000, 10=0.01400, 50=0.01400, 100=0.00500, 1000=0.00300, 10000=0.00200 (USD); Case/Package: 0402; Number of Pins: 2; Case Code (Imperial): 0402; Case Code (Metric): 1005; Min Operating Temperature: -55°C; Max Operating Temperature: 155°C; Resistor Type: Thick Film; Tolerance: 1%; Packaging: Tape and Reel; Voltage Rating: 50V; Termination: SMD/SMT; Working Voltage: 50V; Number of Terminations: 2; Features: Moisture Resistant; Series: RC; Resistance Tolerance: 1%; Construction: Rectangular; Length: 1mm; Width: 0.5mm; Height: 0.32mm; Depth: 0.5mm; Lead Pitch: 0.2mm; REACH SVHC: No SVHC; Lead Free: Lead Free; RoHS Compliant: Yes; Military Standard: Not; ComponentLink1URL: https://datasheet.ciiva.com/7660/38568-7660787.pdf?src-supplier=Element14; ComponentLink1Description: https://datasheet.ciiva.com/7660/38568-7660787.pdf?src-supplier=Element14; ComponentLink2URL: https://datasheet.ciiva.com/7849/1686128-7849814.pdf?src-supplier=Element14; ComponentLink2Description: https://datasheet.ciiva.com/7849/1686128-7849814.pdf?src-supplier=Element14; ComponentLink3URL: https://datasheet.ciiva.com/7983/1018594-7983486.pdf?src-supplier=Element14; ComponentLink3Description: https://datasheet.ciiva.com/7983/1018594-7983486.pdf?src-supplier=Element14; ComponentLink4URL: https://datasheet.ciiva.com/22747/1018594-22747512.pdf?src-supplier=Element14; ComponentLink4Description: https://datasheet.ciiva.com/22747/1018594-22747512.pdf?src-supplier=Element14; ComponentLink5URL: https://datasheet.ciiva.com/12667/pyu-rc0402-51-rohs-l-6-r-12667067.pdf?src-supplier=Mouser; ComponentLink5Description: https://datasheet.ciiva.com/12667/pyu-rc0402-51-rohs-l-6-r-12667067.pdf?src-supplier=Mouser; ComponentLink6URL: https://datasheet.ciiva.com/7849/1784430-7849813.pdf?src-supplier=Element14; ComponentLink6Description: https://datasheet.ciiva.com/7849/1784430-7849813.pdf?src-supplier=Element14; ComponentLink7URL: https://datasheet.ciiva.com/7849/1784430-7849815.pdf?src-supplier=Element14; ComponentLink7Description: https://datasheet.ciiva.com/7849/1784430-7849815.pdf?src-supplier=Element14; Supplier Part Number 1: 603-RC0402FR-0710KL; LCSC Part Number: C60490
TP34 TP35 TP40 = TEST POINT 0.5mm Dia: Test Point ON; Item Type: Test Point; Manufacturer Part Number: TEST POINT 0.5mm Dia
U39-U42 = LTV-247: OPTOISO 3.75KV 4CH TRANS 16SO; Manufacturer: Vishay Lite-On; Number of Channels: 4; Collector Emitter Voltage (VCEO): 80V; Reverse Breakdown Voltage: 6V; Forward Voltage: 1.2V; Forward Current: 20mA; Max Power Dissipation: 200mW; Output Current per Channel: 50mA; Collector Emitter Saturation Voltage: 400mV; Power Dissipation: 170mW; Current Transfer Ratio: 600%; Item Type: PhotoTransistor; Supplier 1: Future Electronics; Manufacturer Part Number: LTV-247; RoHS: Yes; Category: Optocouplers; Stock 1: 178000; Pricing 1: 2000=0.77000 (USD); Mount: Surface Mount; Case/Package: SMD/SMT; Number of Pins: 16; Min Operating Temperature: -55°C; Max Operating Temperature: 110°C; Package Quantity: 2000; Packaging: Tape and Reel; Max Output Voltage: 80V; Max Collector Current: 50mA; Number of Elements: 4; Max Input Current: 50mA; Radiation Hardening: No; RoHS Compliant: Yes; ComponentLink1URL: https://datasheet.ciiva.com/24015/ltv-247-256860-24015561.pdf?src-supplier=Mouser; ComponentLink1Description: https://datasheet.ciiva.com/24015/ltv-247-256860-24015561.pdf?src-supplier=Mouser; ComponentLink2URL: https://datasheet.ciiva.com/29730/ltv-214-244-29730320.pdf?src-supplier=Digi-Key; ComponentLink2Description: https://datasheet.ciiva.com/29730/ltv-214-244-29730320.pdf?src-supplier=Digi-Key; Supplier Part Number 1: 3051235; LCSC Part Number: C115451; ComponentLink3Description: LCSC; ComponentLink3URL: https://www.lcsc.com/product-detail/Optocouplers-Phototransistor-Output_Lite-On-LTV-247_C115451.html
U43 = TLP2361(TPL,E(T: 15Mbit/s 80ns 2.7V~5.5V 20kV/us DC SO-5 Logic Output Optoisolators ROHS; Manufacturer: Toshiba; Supplier: Arrow Electronics; LCSC Part Number: C107626; Manufacturer Part Number: TLP2361(TPL,E(T; RoHS: No; Stock: 15000; Pricing: 3000=0.3233, 6000=0.3199, 9000=0.3167, 12000=0.3136, 15000=0.3102, 30000=0.3071 (USD); ComponentLink1URL: https://datasheet.octopart.com/TLP2361%28TPL%2CE%28T-Toshiba-datasheet-62094047.pdf?src-supplier=TME; ComponentLink1Description: https://datasheet.octopart.com/TLP2361%28TPL%2CE%28T-Toshiba-datasheet-62094047.pdf?src-supplier=TME; Item Type: Optoisolator

## Sheet Servo4.SchDoc
size 420 x 297 mm; SheetNumber: 22; SheetTotal: 26
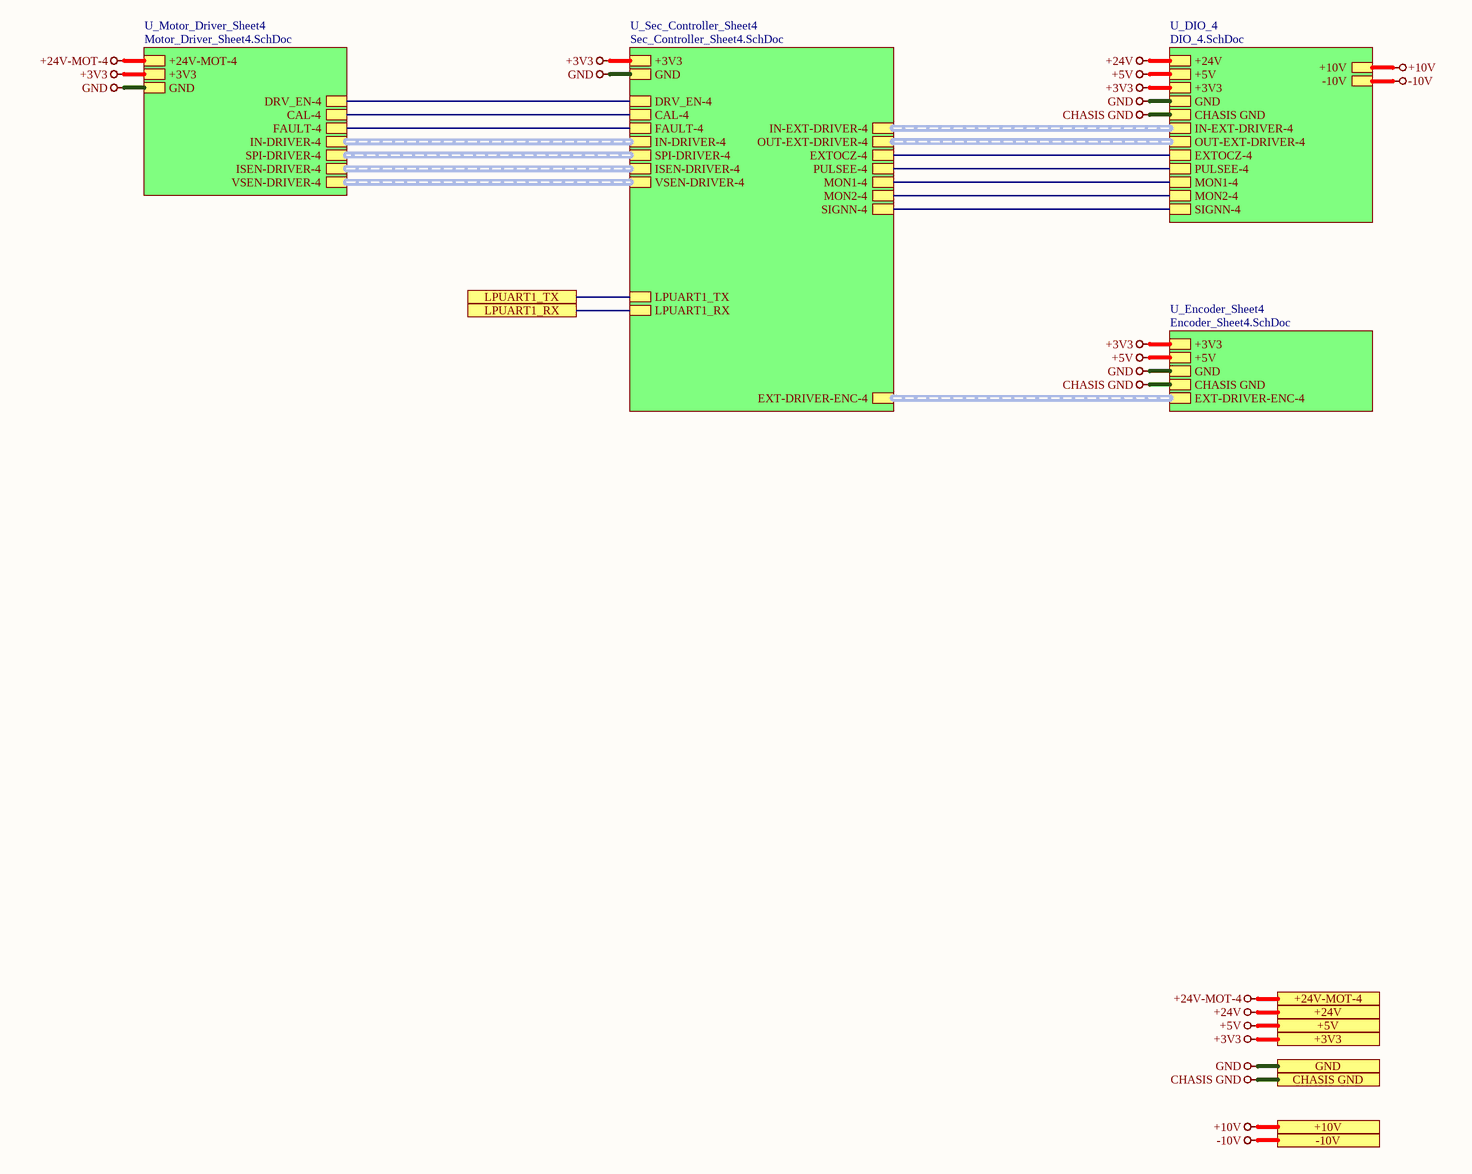
[diagram p10: Servo4.SchDoc]

### Sub-sheets
U_DIO_4 = DIO_4.SchDoc: +24V, +5V, GND, +3V3, CHASIS GND, IN-EXT-DRIVER-4 (harness IN-EXT-DRIVER-4), OUT-EXT-DRIVER-4 (harness OUT-EXT-DRIVER-4), EXTOCZ-4, PULSEE-4, MON1-4, MON2-4, SIGNN-4, +10V, -10V
U_Encoder_Sheet4 = Encoder_Sheet4.SchDoc: +3V3, +5V, GND, CHASIS GND, EXT-DRIVER-ENC-4 (harness EXT-DRIVER-ENC-4)
U_Motor_Driver_Sheet4 = Motor_Driver_Sheet4.SchDoc: +24V-MOT-4, +3V3, GND, DRV_EN-4, CAL-4, FAULT-4, IN-DRIVER-4 (harness IN-DRIVER-4), SPI-DRIVER-4 (harness SPI-DRIVER-4), ISEN-DRIVER-4 (harness ISEN-DRIVER-4), VSEN-DRIVER-4 (harness VSEN-DRIVER-4)
U_Sec_Controller_Sheet4 = Sec_Controller_Sheet4.SchDoc: +3V3, GND, IN-DRIVER-4 (harness IN-DRIVER-4), DRV_EN-4, CAL-4, FAULT-4, SPI-DRIVER-4 (harness SPI-DRIVER-4), ISEN-DRIVER-4 (harness ISEN-DRIVER-4), EXT-DRIVER-ENC-4 (harness EXT-DRIVER-ENC-4), IN-EXT-DRIVER-4 (harness IN-EXT-DRIVER-4), OUT-EXT-DRIVER-4 (harness OUT-EXT-DRIVER-4), EXTOCZ-4, PULSEE-4, MON1-4, MON2-4, SIGNN-4, LPUART1_TX, LPUART1_RX, VSEN-DRIVER-4 (harness VSEN-DRIVER-4)

### Ports
+3V3 (see Top_Sheet[5C], CAN_Sheet[4D], Controller_Sheet[5D], DIO_1[5D], DIO_2[5D], DIO_3[5D], DIO_4[5D], Encoder_Sheet1[5D], Encoder_Sheet2[4D], Encoder_Sheet3[4D], Encoder_Sheet4[5D], EtherCAT_Sheet[5D], Motor_Driver_Sheet1[5D], Motor_Driver_Sheet2[5D], Motor_Driver_Sheet3[5D], Motor_Driver_Sheet4[5D], Power_Sheet[5D], RS485_RS232_Sheet[5D], Sec_Controller_Sheet1[5D], Sec_Controller_Sheet2[5D], Sec_Controller_Sheet3[5D], Sec_Controller_Sheet4[5D], Servo1[5D], Servo2[5D], Servo3[5D]), +5V (see Top_Sheet[5C], CAN_Sheet[4D], Controller_Sheet[5D], DIO_1[5D], DIO_2[5D], DIO_3[5D], DIO_4[5D], Encoder_Sheet1[5D], Encoder_Sheet2[4D], Encoder_Sheet3[4D], Encoder_Sheet4[5D], Power_Sheet[5D], Servo1[5D], Servo2[5D], Servo3[5D]), +10V (see Top_Sheet[5C], DIO_1[5D], DIO_2[5D], DIO_3[5D], DIO_4[5D], Power_Sheet[5D], Servo1[5D], Servo2[5D], Servo3[5D]), +24V (see Top_Sheet[5C], DIO_1[5D], DIO_2[5D], DIO_3[5D], DIO_4[5D], Power_Sheet[5D], Servo1[5D], Servo2[5D], Servo3[5D]), +24V-MOT-4 (see Top_Sheet[5C], Motor_Driver_Sheet4[5D], Power_Sheet[5D]), -10V (see Top_Sheet[5C], DIO_1[5D], DIO_2[5D], DIO_3[5D], DIO_4[5D], Power_Sheet[5D], Servo1[5D], Servo2[5D], Servo3[5D]), CHASIS GND (see Top_Sheet[5C], DIO_1[5D], DIO_2[5D], DIO_3[5D], DIO_4[5D], Encoder_Sheet1[5D], Encoder_Sheet2[4D], Encoder_Sheet3[4D], Encoder_Sheet4[5D], EtherCAT_Sheet[5D], Power_Sheet[5D], Servo1[5D], Servo2[5D], Servo3[5D]), GND (see Top_Sheet[5C], CAN_Sheet[4D], Controller_Sheet[5D], DIO_1[5D], DIO_2[5D], DIO_3[5D], DIO_4[5D], Encoder_Sheet1[5D], Encoder_Sheet2[4D], Encoder_Sheet3[4D], Encoder_Sheet4[5D], EtherCAT_Sheet[5D], Motor_Driver_Sheet1[5D], Motor_Driver_Sheet2[5D], Motor_Driver_Sheet3[5D], Motor_Driver_Sheet4[5D], Power_Sheet[5D], RS485_RS232_Sheet[5D], Sec_Controller_Sheet1[5D], Sec_Controller_Sheet2[5D], Sec_Controller_Sheet3[5D], Sec_Controller_Sheet4[5D], Servo1[5D], Servo2[5D], Servo3[5D]), LPUART1_RX (see Top_Sheet[5C], Controller_Sheet[4D], Sec_Controller_Sheet4[5D]), LPUART1_TX (see Top_Sheet[5C], Controller_Sheet[4D], Sec_Controller_Sheet4[5D])

### Nets
+3V3: port +3V3, sheet U_Sec_Controller_Sheet4/+3V3, sheet U_Motor_Driver_Sheet4/+3V3, sheet U_Encoder_Sheet4/+3V3, sheet U_DIO_4/+3V3
+5V: port +5V, sheet U_Encoder_Sheet4/+5V, sheet U_DIO_4/+5V
+10V: port +10V, sheet U_DIO_4/+10V
+24V: port +24V, sheet U_DIO_4/+24V
+24V-MOT-4: port +24V-MOT-4, sheet U_Motor_Driver_Sheet4/+24V-MOT-4
-10V: port -10V, sheet U_DIO_4/-10V
CHASIS GND: port CHASIS GND, sheet U_Encoder_Sheet4/CHASIS GND, sheet U_DIO_4/CHASIS GND
GND: port GND, sheet U_Sec_Controller_Sheet4/GND, sheet U_Motor_Driver_Sheet4/GND, sheet U_Encoder_Sheet4/GND, sheet U_DIO_4/GND
CAL-4: sheet U_Sec_Controller_Sheet4/CAL-4, sheet U_Motor_Driver_Sheet4/CAL-4
DRV_EN-4: sheet U_Sec_Controller_Sheet4/DRV_EN-4, sheet U_Motor_Driver_Sheet4/DRV_EN-4
EXTOCZ-4: sheet U_Sec_Controller_Sheet4/EXTOCZ-4, sheet U_DIO_4/EXTOCZ-4
FAULT-4: sheet U_Sec_Controller_Sheet4/FAULT-4, sheet U_Motor_Driver_Sheet4/FAULT-4
LPUART1_RX: port LPUART1_RX, sheet U_Sec_Controller_Sheet4/LPUART1_RX
LPUART1_TX: port LPUART1_TX, sheet U_Sec_Controller_Sheet4/LPUART1_TX
MON1-4: sheet U_Sec_Controller_Sheet4/MON1-4, sheet U_DIO_4/MON1-4
MON2-4: sheet U_Sec_Controller_Sheet4/MON2-4, sheet U_DIO_4/MON2-4
PULSEE-4: sheet U_Sec_Controller_Sheet4/PULSEE-4, sheet U_DIO_4/PULSEE-4
SIGNN-4: sheet U_Sec_Controller_Sheet4/SIGNN-4, sheet U_DIO_4/SIGNN-4

### Buses and harness runs
harness sheet U_DIO_4/IN-EXT-DRIVER-4 = sheet U_Sec_Controller_Sheet4/IN-EXT-DRIVER-4
harness sheet U_DIO_4/OUT-EXT-DRIVER-4 = sheet U_Sec_Controller_Sheet4/OUT-EXT-DRIVER-4
harness sheet U_Encoder_Sheet4/EXT-DRIVER-ENC-4 = sheet U_Sec_Controller_Sheet4/EXT-DRIVER-ENC-4
harness sheet U_Motor_Driver_Sheet4/IN-DRIVER-4 = sheet U_Sec_Controller_Sheet4/IN-DRIVER-4
harness sheet U_Motor_Driver_Sheet4/ISEN-DRIVER-4 = sheet U_Sec_Controller_Sheet4/ISEN-DRIVER-4
harness sheet U_Motor_Driver_Sheet4/SPI-DRIVER-4 = sheet U_Sec_Controller_Sheet4/SPI-DRIVER-4
harness sheet U_Motor_Driver_Sheet4/VSEN-DRIVER-4 = sheet U_Sec_Controller_Sheet4/VSEN-DRIVER-4

### Notes on the sheet
- File:
- Title:
- Date:
- Page
- Num:
- Total:
- Drawn By: Huzaifa Ali